# EasyEDA Pro project bikeCtrl.eprj

# Schematic Schematic1
Board Name: Board1; Create Date: 2025-06-26; Page Name: P1; Project Name: bikeCtrl; Schematic Name: Schematic1; Update Date: 2025-06-26; Company: 嘉立创EDA; Page Size: A4; Version: V1.0
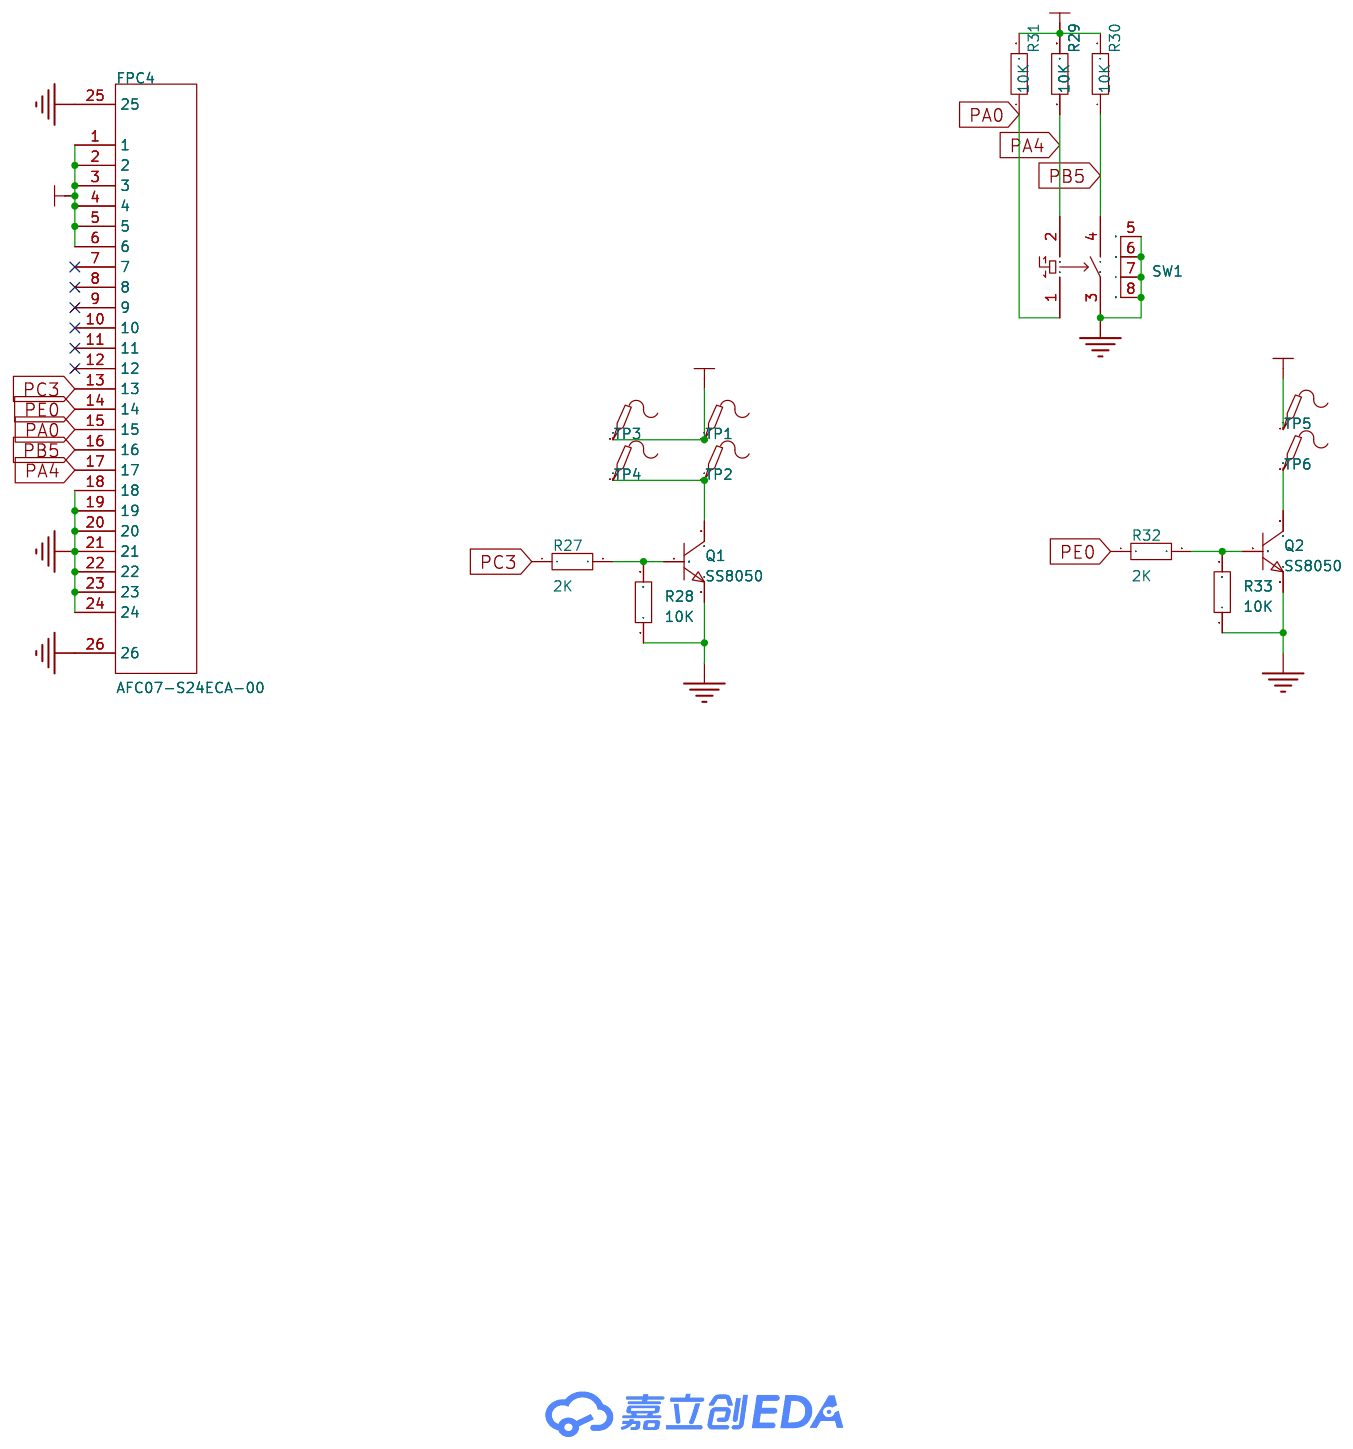
[diagram p0: schematic sheet]

## Parts
FPC4  AFC07-S24ECA-00  [FPC-SMD_AFC07-S24ECA-00]
Q1  SS8050  [SOT-23-3_L2.9-W1.3-P1.90-LS2.4-BR]
Q2  SS8050  [SOT-23-3_L2.9-W1.3-P1.90-LS2.4-BR]
R27  2K  [R0603]
R28  10K  [R0603]
R29  10K  [R0603]
R30  10K  [R0603]
R31  10K  [R0603]
R32  2K  [R0603]
R33  10K  [R0603]
SW1  TM-2024A  [SW-SMD_TM-2024A]
TP1  -  [Test-Point-0.5mm]
TP2  -  [Test-Point-0.5mm]
TP3  -  [Test-Point-0.5mm]
TP4  -  [Test-Point-0.5mm]
TP5  -  [Test-Point-0.5mm]
TP6  -  [Test-Point-0.5mm]

## Library data of the parts
FPC4 = AFC07-S24ECA-00: 锁定特性:抽屉式;触点类型:上接;触点数量:24P;间距:0.5mm;安装类型:卧贴;; LCSC Part Name: 间距:0.5mm P数:24P 抽屉式 上接; Supplier Part: C262643; Manufacturer: JS(钜硕电子); Supplier Footprint: SMD,P=0.5mm,卧贴; JLCPCB Part Class: 扩展库; Datasheet: https://atta.szlcsc.com/upload/public/pdf/source/20190726/C11082_A2E7B12387019CE4314BB5199EE0FDF4.pdf; Supplier: LCSC; Locking Feature: 抽屉式; Contact Type: 上接; Number of Contacts: 24P; Pitch: 0.5mm; Mounting Type: 卧贴; FFC, FCB Thickness: 0.3mm; Height Above Board: 2mm
Q1 Q2 = SS8050_C916392: 晶体管类型:NPN;集电极电流(Ic):1.5A;集射极击穿电压(Vceo):25V;功率(Pd):300mW;直流电流增益(hFE@Ic,Vce):-;; LCSC Part Name: NPN 电流:1.5A 耐压:25V; Supplier Part: C916392; Manufacturer: JSMSEMI(杰盛微); Supplier Footprint: SOT-23; JLCPCB Part Class: 扩展库; Datasheet: https://atta.szlcsc.com/upload/public/pdf/source/20230807/CAABCAAF77D43CB838E37CFA5C9BFE5C.pdf; Supplier: LCSC; Transistor Type: NPN; Collector Current (Ic): 1.5A; Collector-Emitter Breakdown Voltage (Vceo): 25V; Power Dissipation (Pd): 300mW; Collector Cut-Off Current (Icbo): 100nA; Collector-Emitter Saturation Voltage (VCE(sat)@Ic,Ib): 500mV@800mA,80mA; Operating Temperature: -55℃~+150℃
R27-R33 = Res_0603: Supplier Footprint: 0603
SW1 = TM-2024A: LCSC Part Name: 四脚两档拨轮开关TM-2024A; Supplier Part: C561480; Manufacturer: XKB Connection(中国星坤); Supplier Footprint: SMD; JLCPCB Part Class: 扩展库; Datasheet: https://atta.szlcsc.com/upload/public/pdf/source/20211011/7A4DB3DC37E7D5823B6D92C66ED3191E.pdf; Supplier: LCSC
TP1-TP6 = Test-Point: Test Point 测试点

## Nets
GND: FPC4.18 FPC4.19 FPC4.20 FPC4.21 FPC4.22 FPC4.23 FPC4.24 FPC4.25 FPC4.26 Q1.2(E) Q2.2(E) R28.1 R33.1 SW1.3 SW1.5 SW1.6 SW1.7 SW1.8
VCC3V3: FPC4.1 FPC4.2 FPC4.3 FPC4.4 FPC4.5 FPC4.6 R29.2 R30.2 R31.2 TP1.1 TP3.1 TP5.1
PA0: FPC4.15 R31.1 SW1.1
PA4: FPC4.17 R29.1 SW1.2
PB5: FPC4.16 R30.1 SW1.4
PC3: FPC4.13 R27.1
PE0: FPC4.14 R32.1
$1N1204: Q1.3(C) TP2.1 TP4.1
$1N1206: Q1.1(B) R27.2 R28.2
$1N1777: Q2.1(B) R32.2 R33.2
$1N1778: Q2.3(C) TP6.1

Not connected (* = marked no-connect by the designer): FPC4 7* 8* 9* 10* 11* 12*

# Board PCB1
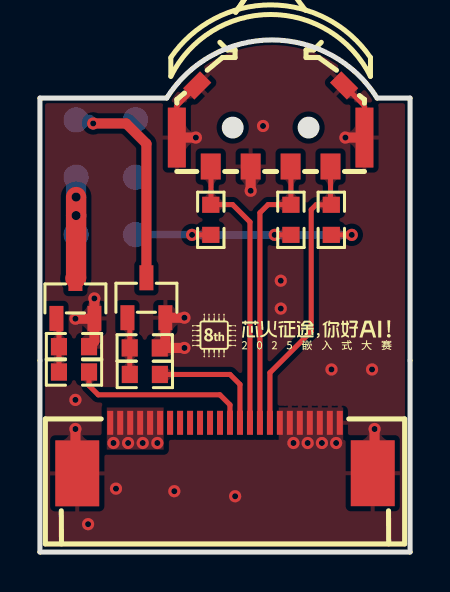
[diagram p1: board, top side]
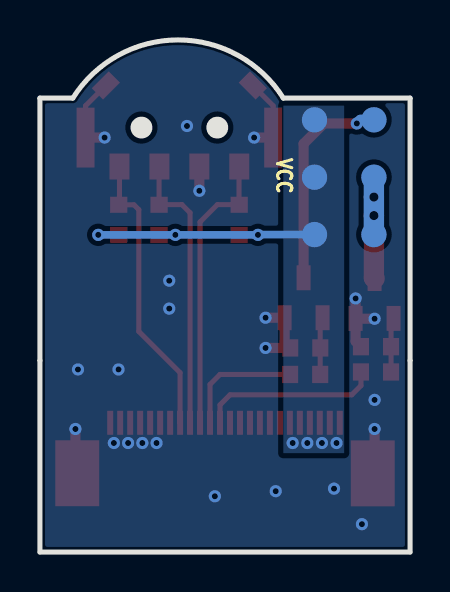
[diagram p2: board, bottom side, seen from below]

Outline 18.54 x 25.65 mm; copper layers: Top Layer, Bottom Layer. Coordinates in mm from the lower left corner of the outline.
Outline path: 0,22.73 6.35,22.73 arc(11.62,25.65) 16.89,22.73 18.54,22.73 18.54,0 0,0 0,22.73
Stack: Top Layer 0.035mm / Dielectric1 1.51mm FR4 er 4.5 / Bottom Layer 0.035mm

## Design rules (mm)
template: JLCPCB Capability(Two Layers Board)
spacing copperThickness1oz (default): track to track 0.102, other pairs 0.152 to 0.3
spacing copperThickness2oz: track to track 0.203, other pairs 0.152 to 0.3
track width copperThickness1oz (default): min 0.127, default 0.254, max 2.54
track width copperThickness2oz: min 0.203, default 0.254, max 2.54
differential pair differentialPair (default): width min 0.127, default 0.254, max 2.54; gap min 0.152, default 0.152
via viaSize (default): diameter min 0.5, default 0.61, max 10; hole min 0.3, default 0.305, max 6.3

## Placement (name value [footprint] x y rotation side)
FPC4  AFC07-S24ECA-00  [FPC-SMD_AFC07-S24ECA-00]  9.27 5.21 0 top
Q1  SS8050  [SOT-23-3_L2.9-W1.3-P1.90-LS2.4-BR]  1.78 12.7 270 top
Q2  SS8050  [SOT-23-3_L2.9-W1.3-P1.90-LS2.4-BR]  5.33 12.73 270 top
R27  2K  [R0603]  1.71 9.02 180 top
R28  10K  [R0603]  1.71 10.28 180 top
R29  10K  [R0603]  14.6 16.64 270 top
R30  10K  [R0603]  12.57 16.64 270 top
R31  10K  [R0603]  8.56 16.64 270 top
R32  2K  [R0603]  5.26 8.89 180 top
R33  10K  [R0603]  5.25 10.22 180 top
SW1  TM-2024A  [SW-SMD_TM-2024A]  11.56 21.34 0 top
TP1  -  [Test-Point-0.5mm]  4.79 21.64 0 top
TP2  -  [Test-Point-0.5mm]  1.81 15.9 0 top
TP3  -  [Test-Point-0.5mm]  4.79 18.77 0 top
TP4  -  [Test-Point-0.5mm]  1.81 18.77 0 top
TP5  -  [Test-Point-0.5mm]  4.79 15.9 0 top
TP6  -  [Test-Point-0.5mm]  1.81 21.64 0 top

## Footprints (pads in the part's own frame, mm; a bottom-side part is the same pattern mirrored in y, then rotated)
FPC-SMD_AFC07-S24ECA-00
  rect 0.3x1.2 smd: 1(-5.75,1.266) 2(-5.25,1.266) 3(-4.749,1.266) 4(-4.252,1.266) 5(-3.751,1.266) 6(-3.251,1.266) 7(-2.75,1.266) 8(-2.25,1.266) 9(-1.75,1.266) 10(-1.25,1.266) 11(-0.75,1.266) 12(-0.251,1.266) 13(0.249,1.266) 14(0.75,1.266) 15(1.25,1.266) 16(1.75,1.266) 17(2.25,1.266) 18(2.749,1.266) 19(3.249,1.266) 20(3.749,1.266) 21(4.25,1.266) 22(4.75,1.266) 23(5.251,1.266) 24(5.75,1.266)
  rect 2.2x3.3 smd: 25(-7.401,-1.266) 26(7.401,-1.26)
R0603
  rect 0.806x0.864 smd: 1(-0.753,0) 2(0.753,0)
SOT-23-3_L2.9-W1.3-P1.90-LS2.4-BR
  rect 1.25x0.7 smd: 1(1,-0.95) 2(1,0.95) 3(-1,0)
SW-SMD_TM-2024A
  rect 1x1.3 smd: 1(-3,-2.03) 2(3,-2.03) 3(-1,-2.03) 4(1,-2.03)
  rect 0.9x3 smd: 5(-4.7,-0.58) 6(4.7,-0.58)
  rect 1.2x0.8 smd rot 45: 7(-3.68,2.03)
  rect 1.2x0.8 smd rot 135: 8(3.68,2.03)
Test-Point-0.5mm
  round 1.27 smd far side: 1(0,0)

## Nets
As in the schematic.

Pads without a net: FPC4 7 8 9 10 11 12

## Via types
v1: diameter 0.61, hole 0.305, Top Layer to Bottom Layer, 31 vias
v2: diameter 0.762, hole 0.457, Top Layer to Bottom Layer, 2 vias

## Routing (per net, layer and track width the routed paths; a pad name or vN(x,y) marks a point on that pad's centre or on a via; arc(x,y) is an arc through that point)
GND: length 18.1
  Top Layer w0.254: SW1.6 16.26,22.35 SW1.8 ; SW1.5 6.86,22.35 SW1.7
  Top Layer w0.508: 1.78,5.21 v1(1.78,6.16) ; SW1.5 v1(7.81,20.76) ; SW1.6 v1(15.3,20.76) ; Q1.2 v1(2.73,12.7) ; Q1.2 2.73,10.55 R28.1 ; Q1.2 2.71,11.68 v1(1.78,11.68) ; v1(7.24,10.22) R33.1 6.28,10.5 Q2.2 v1(7.24,11.73) ; 16.76,5.21 v1(16.76,6.16) ; 10.56,19.05 v1(10.56,18.09)
  vias: v1(1.78,7.62) v1(2.41,1.4) v1(3.81,3.17) v1(6.73,3.05) v1(9.78,2.79) v1(11.18,21.34) v1(12.06,13.59) v1(12.06,12.19) v1(12.7,5.46) v1(13.41,5.46) v1(14.13,5.46) v1(14.6,9.14) v1(14.84,5.46) v1(16.64,9.14)
VCC3V3: length 13.6
  Top Layer w0.254: R30.2 v1(11.76,15.88) ; v1(7.62,15.88) R31.2 ; R29.2 v1(15.62,15.88)
  Bottom Layer w0.381: v1(15.62,15.88) v1(11.76,15.88) v1(7.62,15.88) 7.61,15.9 TP5.1
  vias: v1(3.68,5.46) v1(4.42,5.46) v1(5.15,5.46) v1(5.88,5.46)
PA0: length 14.3
  Top Layer w0.254: 8.57,17.4 R31.1 ; 8.57,17.4 9.65,17.4 10.52,16.53 FPC4.15 ; 8.57,17.4 8.57,19.29 SW1.1
PA4: length 14.6
  Top Layer w0.254: SW1.2 14.56,17.43 R29.1 13.83,17.39 13.59,17.14 13.59,11.05 11.52,8.98 FPC4.17
PB5: length 14.2
  Top Layer w0.254: FPC4.16 11.02,16.99 11.43,17.4 12.56,17.4 R30.1 12.57,19.29 SW1.4
PC3: length 9
  Top Layer w0.254: FPC4.13 9.52,7.37 9.02,7.87 2.92,7.87 2.46,8.34 R27.1
PE0: length 6.1
  Top Layer w0.254: FPC4.14 10.02,8.39 9.52,8.89 R32.1
$1N1204: length 7
  Top Layer w1.016: Q1.3 1.81,13.73 v2(1.81,16.85) v2(1.81,17.78)
  Bottom Layer w1.016: TP4.1 v2(1.81,17.78) v2(1.81,16.85) TP2.1
$1N1206: length 2.7
  Top Layer w0.254: R27.2 R28.2 0.95,11.58 Q1.1
$1N1777: length 2.9
  Top Layer w0.254: 4.5,8.89 4.5,11.62 Q2.1
$1N1778: length 10.7
  Top Layer w0.508: Q2.3 5.33,20.45 4.32,21.46 v1(2.67,21.46)
  Bottom Layer w0.508: TP6.1 2.49,21.64 v1(2.67,21.46)

## Copper pours and planes (outline as drawn; the poured copper is in the pictures)
GND on Top Layer: -0.76,26.67 20.19,26.67 20.19,-1.52 -0.76,-1.52
GND on Top Layer: 11.96,7.25 15.19,7.25 15.19,5.14 11.96,5.14
GND on Bottom Layer: -1.4,26.16 19.81,26.16 19.81,-1.27 -1.4,-1.27
VCC3V3 on Top Layer: 3.35,7.24 6.2,7.24 6.2,5.13 3.35,5.13
VCC3V3 on Bottom Layer: 3.3,22.35 6.35,22.35 6.35,4.95 3.3,4.95

Small or netless copper shapes (teardrops, artwork), in the pictures only: 51 on Top Layer, 4 on Bottom Layer

## Text on the board
Bottom Silkscreen Layer: VCC
